# EAGLE board RobotRacers_RevQ (EAGLE 9.7.0), part 1 of 3
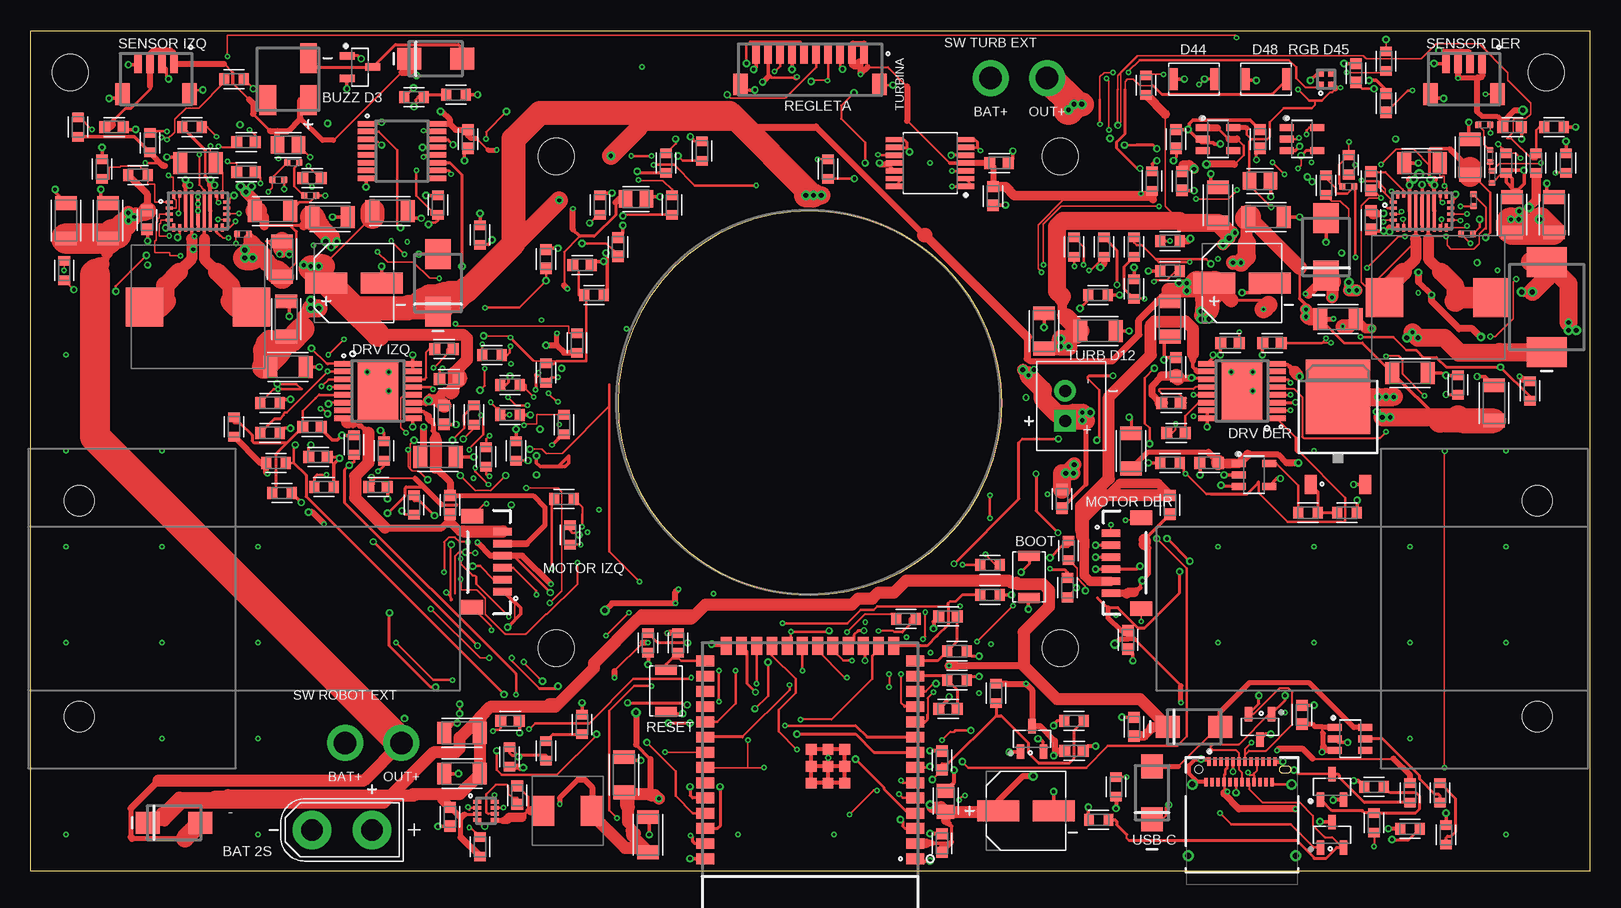
[diagram p14: board, top side]
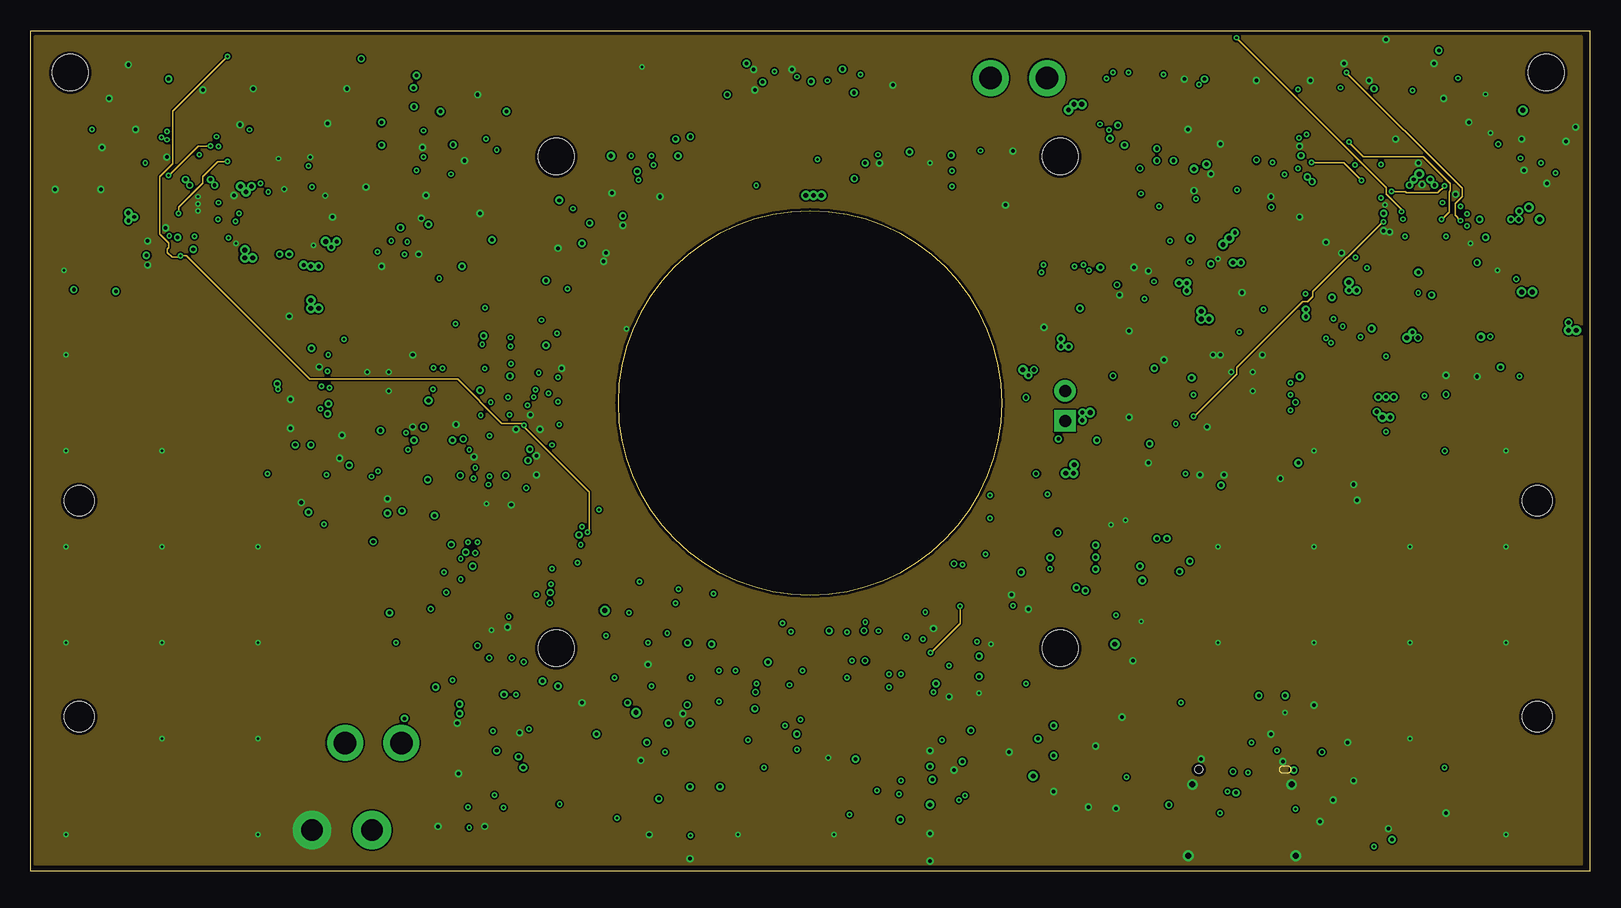
[diagram p15: board, inner layer Route2]
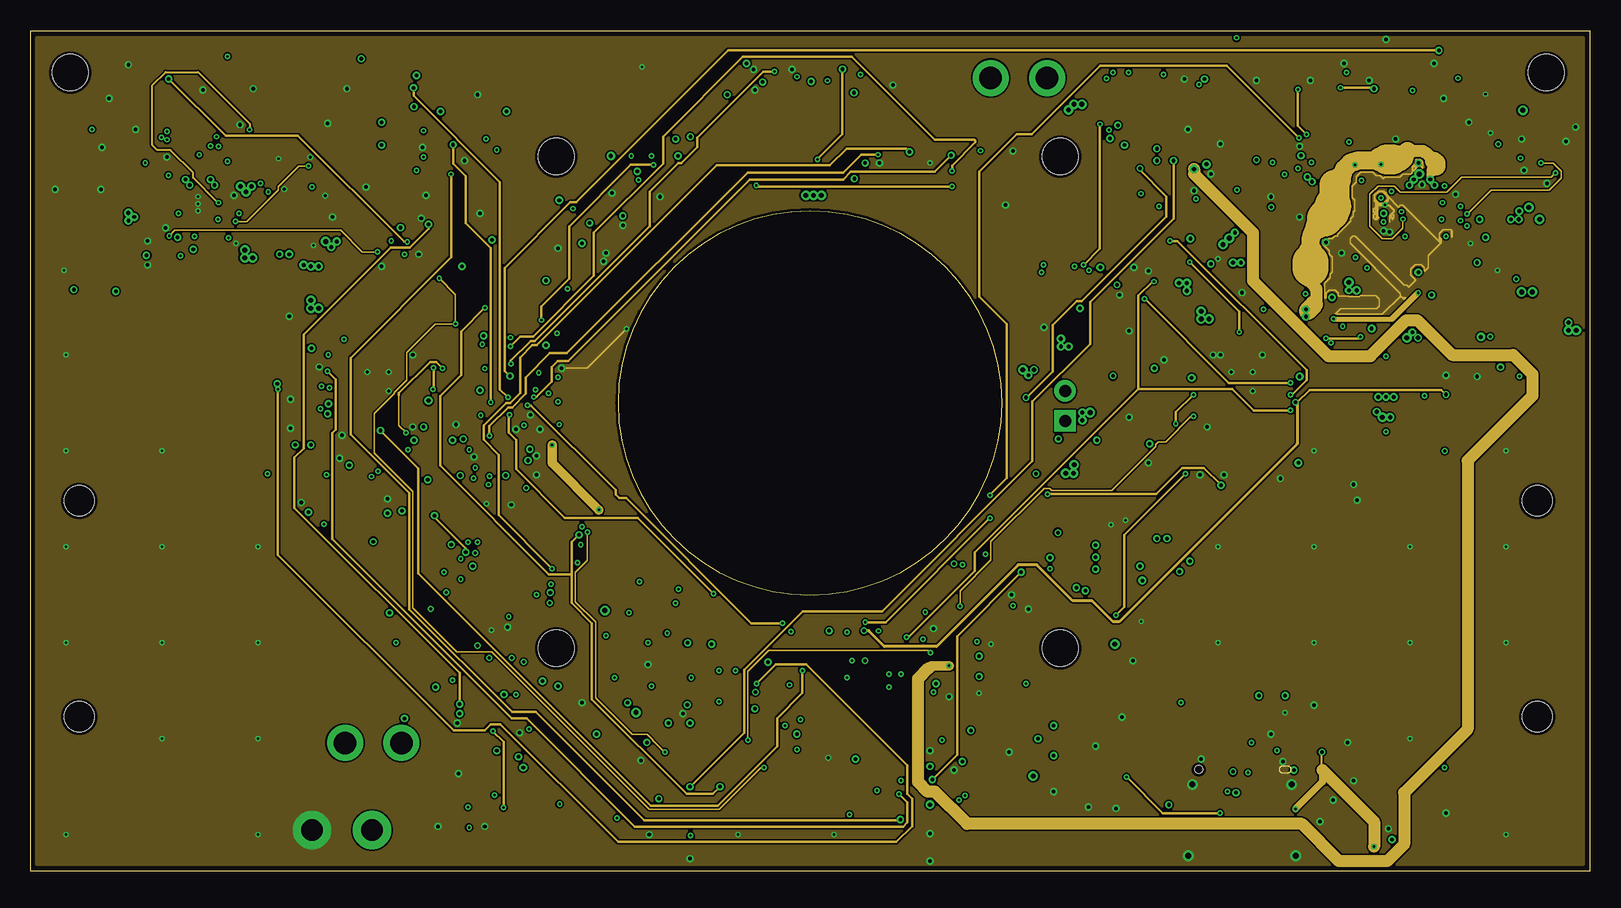
[diagram p16: board, inner layer Route15]
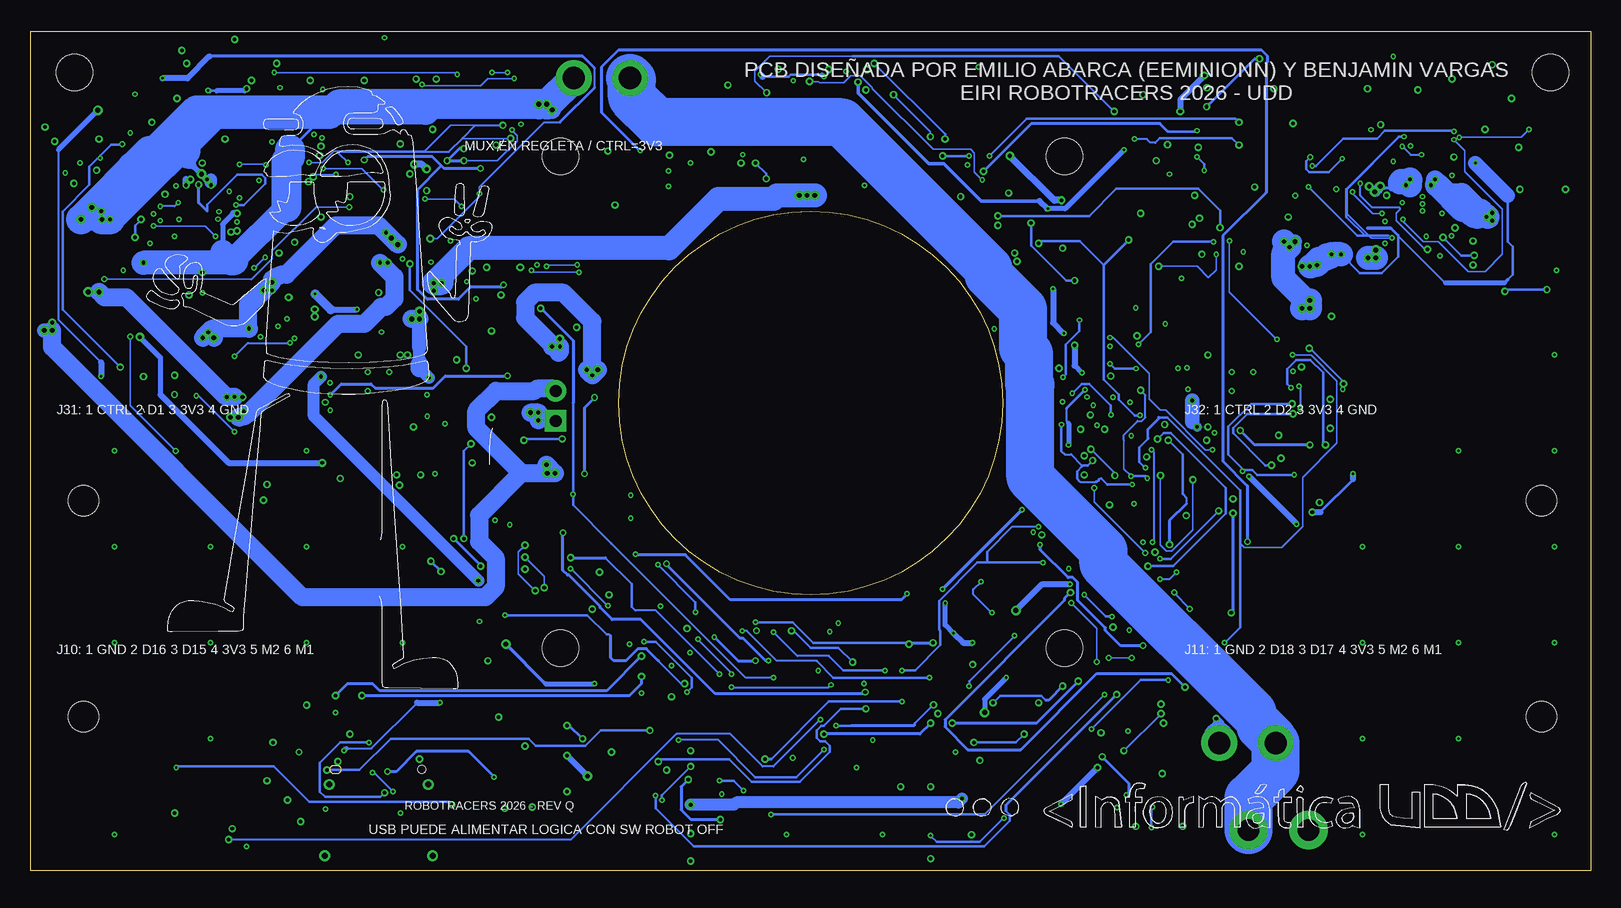
[diagram p17: board, bottom side, seen from below]

Size 130 x 70 mm. Coordinates in mm from the lower left corner, seen from the top.
Outline: 0,0 130,0 130,70 0,70 0,0
Outline: 81,39 arc180 49,39 arc180 81,39
Copper layers (1+2*15+16): Top 0.035mm / dielectric 0.2104mm / Route2 0.0152mm / dielectric 1.065mm / Route15 0.0152mm / dielectric 0.2104mm / Bottom 0.035mm
Design rules "RobotRacers Rev K - 4L L2-GND L3-signal-GND JLC04161H-7628": minimum track width 5mil, minimum drill 0.2mm, track to track 5mil, track to pad 5mil, pad to pad 0.16mm, via to via 0.16mm, smd to smd 0.16mm, copper to edge 0.25mm, drill to drill 6mil, minimum pad ring 0.2mm, minimum via ring 0.125mm, stop-mask expansion 0.05mm, vias tented up to drill 0.3mm, thermal gap 10mil
Net classes: 0 default: width 0.127 mm, drill 0.2 mm
Holes 3 mm at 43.85,18.55 43.85,59.55 85.85,18.55 85.85,59.55 3.35,66.55 126.35,66.55
Holes 2.5 mm at 4.1,12.85 4.1,30.85 125.6,12.85 125.6,30.85
tKeepout: area 41.4,16.1 to 46.4,21.1; area 41.4,57 to 46.4,62; area 83.3,16.1 to 88.3,21.1; area 83.3,57 to 88.3,62; area -0.1,8.6 to 17.2,15.1; area -0.1,15.1 to 35.9,28.7; area -0.1,28.7 to 17.2,35.1; area 112.5,8.6 to 129.8,15.1; area 93.8,15.1 to 129.8,28.7; area 112.5,28.7 to 129.8,35.1; area 0.8,64 to 5.8,69; area 123.8,64 to 128.8,69; area 46.9,21.1 to 82.8,57
bKeepout: area 41.4,16.1 to 46.4,21.1; area 41.4,57 to 46.4,62; area 83.3,16.1 to 88.3,21.1; area 83.3,57 to 88.3,62; area -0.1,8.6 to 17.2,15.1; area -0.1,15.1 to 35.9,28.7; area -0.1,28.7 to 17.2,35.1; area 112.5,8.6 to 129.8,15.1; area 93.8,15.1 to 129.8,28.7; area 112.5,28.7 to 129.8,35.1; area 0.8,64 to 5.8,69; area 123.8,64 to 128.8,69; area 46.9,21.1 to 82.8,57
tRestrict: area 48.9,23.1 to 80.8,55; area 1.1,9.9 to 7.1,15.9; area 1.1,27.9 to 7.1,33.8; area 122.6,9.9 to 128.6,15.9; area 122.6,27.9 to 128.6,33.8; area 41.4,16.1 to 46.4,21.1; area 41.4,57 to 46.4,62; area 83.3,16.1 to 88.3,21.1; area 83.3,57 to 88.3,62; area 0.8,64 to 5.8,69; area 123.8,64 to 128.8,69
vRestrict: area 48.9,23.1 to 80.8,55; area 1.1,9.9 to 7.1,15.9; area 1.1,27.9 to 7.1,33.8; area 122.6,9.9 to 128.6,15.9; area 122.6,27.9 to 128.6,33.8; area 41.4,16.1 to 46.4,21.1; area 41.4,57 to 46.4,62; area 83.3,16.1 to 88.3,21.1; area 83.3,57 to 88.3,62; area 0.8,64 to 5.8,69; area 123.8,64 to 128.8,69

## Footprints (pad centres in the part's own frame; a part is rotated, then mirrored left to right if it is on the bottom)
MLT5030 = smd 1.4 x 2.5: DUMMY -1.7,-1.75; N 1.7,1.75; P 1.7,-1.75
CAPC2012X110 = smd 1.165 x 1.465: 1 -0.875,0; 2 0.875,0
CAPC1608X85 = smd 0.921 x 0.97: 1 -0.775,0; 2 0.775,0
CAPC3216X135 = smd 1.165 x 1.815: 1 -1.475,0; 2 1.475,0
CAPC1005_0402 = smd 0.55 x 0.6: 1 -0.5,0; 2 0.5,0
CAPAE660X540N = smd 3.517 x 1.767: 1 -2.3,0; 2 2.3,0
SMC_DO214AB = smd 2.5 x 3.3: 1 -3.75,0; 2 3.75,0
SK6805_EC15 = smd 0.55 x 0.55: 1 -0.475,-0.475; 2 0.475,-0.475; 3 0.475,0.475; 4 -0.475,0.475
SS14 = smd 2 x 1.8: A 2.2,0; K -2.2,0
SMBJ6.5A = smd 2.5 x 2.1: A 2.4,0; K -2.4,0
12401832E402A = smd 0.3 x 0.7: A1 -2.75,5; A2 -2.25,5; A3 -1.75,5; A4 -1.25,5; A5 -0.75,5; A6 -0.25,5; A7 0.25,5; A8 0.75,5; A9 1.25,5; A10 1.75,5; A11 2.25,5; A12 2.75,5; B1 2.5,3.3; B2 2,3.3; B3 1.5,3.3; B4 1,3.3; B5 0.5,3.3; B6 0,3.3; B7 -0.5,3.3; B8 -1,3.3; B9 -1.5,3.3; B10 -2,3.3; B11 -2.5,3.3; B12 -3,3.3 | drill 0.5 slot 1.1 rotated 90: SH1 -4.13,3.09; SH2 4.13,3.09; SH3 4.49,-2.86; SH4 -4.49,-2.86 | hole 0.65: -3.6,4.34
JST-6-SMD-VERT-1.0MM = smd 0.6 x 1.55: 1 2.46,1.27; 2 1.46,1.27; 3 0.46,1.27; 4 -0.54,1.27; 5 -1.54,1.27; 6 -2.54,1.27 | smd 1.2 x 1.8: P$1 -3.84,-1.255; P$2 3.76,-1.255
JST_XH_B2B_VERTICAL = drill 1 pad 1.8 square: 1 -1.25,0 | drill 1 pad 1.8: 2 1.25,0
XT30UPB-M = drill 1.8 pad 3.2: + 2.5,0; - -2.5,0
JST_SH_10 = smd 0.6 x 1.55: 1 4.5,1.27; 2 3.5,1.27; 3 2.5,1.27; 4 1.5,1.27; 5 0.5,1.27; 6 -0.5,1.27; 7 -1.5,1.27; 8 -2.5,1.27; 9 -3.5,1.27; 10 -4.5,1.27 | smd 1.2 x 1.8: MP1 -5.8,-1.255; MP2 5.8,-1.255
JST_SH_4 = smd 0.6 x 1.55: 1 1.5,1.27; 2 0.5,1.27; 3 -0.5,1.27; 4 -1.5,1.27 | smd 1.2 x 1.8: MP1 -2.8,-1.255; MP2 2.8,-1.255
WIRE_SWITCH_2P = drill 1.85 pad 3: 2 0,0; 3 4.7,0
YSPI0530_REVN = smd 1.9 x 2.5: 1 -2.05,0; 2 2.05,0
IHLP4040DZ_01_4R7 = smd 3.124 x 3.251: 1 -4.471,0; 2 4.471,0
SOT95P237X112-3N = smd 1.224 x 0.625: 1 -1.064,0.95; 2 -1.064,-0.95; 3 1.064,0
TO252 = smd 1 x 1.6: 1 -2.28,-4.8; 2 2.28,-4.8 | smd 5.4 x 6.2: 3 0,2.5
RESC1608X60 = smd 0.799 x 0.974: 1 -0.815,0; 2 0.815,0
RESC3216X70 = smd 1.165 x 1.815: 1 -1.475,0; 2 1.475,0
RESC1005_0402 = smd 0.55 x 0.6: 1 -0.5,0; 2 0.5,0
B3U-1000P(M) = smd 0.8 x 1.8: 1 -1.75,0; 2 1.75,0
ESP32-S3-WROOM-1 = smd 1.5 x 0.9: 1 0.25,18.01; 2 0.25,16.74; 3 0.25,15.47; 4 0.25,14.2; 5 0.25,12.93; 6 0.25,11.66; 7 0.25,10.39; 8 0.25,9.12; 9 0.25,7.85; 10 0.25,6.58; 11 0.25,5.31; 12 0.25,4.04; 13 0.25,2.77; 14 0.25,1.5; 27 17.75,1.5; 28 17.75,2.77; 29 17.75,4.04; 30 17.75,5.31; 31 17.75,6.58; 32 17.75,7.85; 33 17.75,9.12; 34 17.75,10.39; 35 17.75,11.66; 36 17.75,12.93; 37 17.75,14.2; 38 17.75,15.47; 39 17.75,16.74; 40 17.75,18.01 | smd 0.9 x 1.5: 15 2.015,0.25; 16 3.285,0.25; 17 4.555,0.25; 18 5.825,0.25; 19 7.095,0.25; 20 8.365,0.25; 21 9.635,0.25; 22 10.905,0.25; 23 12.175,0.25; 24 13.445,0.25; 25 14.715,0.25; 26 15.985,0.25 | smd 0.9 x 0.9: 41_1 6.1,11.69; 41_2 6.1,10.29; 41_3 6.1,8.89; 41_4 7.5,11.69; 41_5 7.5,10.29; 41_6 7.5,8.89; 41_7 8.9,11.69; 41_8 8.9,10.29; 41_9 8.9,8.89
TI_DRL0008A = smd 0.67 x 0.3: 1 -0.74,0.75; 2 -0.74,0.25; 3 -0.74,-0.25; 4 -0.74,-0.75; 5 0.74,-0.75; 6 0.74,-0.25; 7 0.74,0.25; 8 0.74,0.75
TI_RYQ0021A = smd 0.6 x 0.25: 1 -2.4,0.75; 2 -2.4,0.25; 3 -2.4,-0.25; 4 -2.4,-0.75; 14 2.4,-0.75; 15 2.4,-0.25; 16 2.4,0.25; 17 2.4,0.75 | smd 0.25 x 0.65: 5 -2.04,-1.375; 13 2.04,-1.375; 18 2.04,1.375; 21 -2.04,1.375 | smd 0.25 x 0.6: 6 -1.54,-1.4; 12 1.54,-1.4; 19 1.54,1.4; 20 -1.54,1.4 | smd 0.25 x 3.4: 7 -1.04,0; 8 -0.54,0; 9A 0,0; 10 0.54,0; 11 1.04,0 | smd 0.33 x 2.35: 9 0,0
TI_PWP0016J = smd 1.5 x 0.45: 1 -2.9,2.275; 2 -2.9,1.625; 3 -2.9,0.975; 4 -2.9,0.325; 5 -2.9,-0.325; 6 -2.9,-0.975; 7 -2.9,-1.625; 8 -2.9,-2.275; 9 2.9,-2.275; 10 2.9,-1.625; 11 2.9,-0.975; 12 2.9,-0.325; 13 2.9,0.325; 14 2.9,0.975; 15 2.9,1.625; 16 2.9,2.275 | smd 3.4 x 5: 17 0,0
SOT95P280X145-5N = smd 1.186 x 0.597: 1 -1.264,0.95; 2 -1.264,0; 3 -1.264,-0.95; 4 1.264,-0.95; 5 1.264,0.95
TSSOP16_PW = smd 1.5 x 0.45: 1 -2.95,2.275; 2 -2.95,1.625; 3 -2.95,0.975; 4 -2.95,0.325; 5 -2.95,-0.325; 6 -2.95,-0.975; 7 -2.95,-1.625; 8 -2.95,-2.275; 9 2.95,-2.275; 10 2.95,-1.625; 11 2.95,-0.975; 12 2.95,-0.325; 13 2.95,0.325; 14 2.95,0.975; 15 2.95,1.625; 16 2.95,2.275
SOP65P640X120-14 = smd 1.45 x 0.45: 1 -2.95,1.95; 2 -2.95,1.3; 3 -2.95,0.65; 4 -2.95,0; 5 -2.95,-0.65; 6 -2.95,-1.3; 7 -2.95,-1.95; 8 2.95,-1.95; 9 2.95,-1.3; 10 2.95,-0.65; 11 2.95,0; 12 2.95,0.65; 13 2.95,1.3; 14 2.95,1.95
SOT95P280X145-6N = smd 1.165 x 0.597: 1 -1.275,0.95; 2 -1.275,0; 3 -1.275,-0.95; 4 1.275,-0.95; 5 1.275,0; 6 1.275,0.95

## Placement (x,y rotation side)
BZ1  MLT-5030  [MLT5030]  21.5,66 0 top
C1  10uF / 10V X7R  [CAPC2012X110]  76.3,5.8 270 top
C2  100nF / 16V X7R  [CAPC1608X85]  76,2.3 270 top
C3  1uF / 10V X7R  [CAPC1608X85]  76,9.2 270 top
C4  100nF / 16V X7R  [CAPC1608X85]  87,10 180 top
C5  DNP 10pF 50V C0G  [CAPC1608X85]  76.5,21.2 0 top
C6  DNP 10pF 50V C0G  [CAPC1608X85]  76.5,13.5 0 top
C100  100nF  [CAPC1608X85]  40,12.5 0 top
C101  22uF/25V  [CAPC3216X135]  36,8.1 180 top
C102  22uF/25V  [CAPC3216X135]  36,11.5 180 top
C103  100nF  [CAPC1608X85]  35,4.5 270 top
C104  100nF  [CAPC1608X85]  40.6,6.3 90 top
C105  22uF/25V  [CAPC3216X135]  51.5,3 90 top
C106  22uF/25V  [CAPC3216X135]  49.5,8 90 top
C110  22uF/25V  [CAPC3216X135]  6.5,54.2 90 top
C111  22uF/25V  [CAPC3216X135]  3,54.2 90 top
C112  100nF  [CAPC1608X85]  9.75,54.25 270 top
C113  22uF/25V  [CAPC3216X135]  14,59 180 top
C114  100nF  [CAPC1608X85]  18,58.25 0 top
C115  100nF  [CAPC1608X85]  18,60.75 180 top
C116  100nF  [CAPC1608X85]  23.5,57.75 0 top
C117  22uF/25V  [CAPC3216X135]  20.2,55 0 top
C118  22uF/25V  [CAPC3216X135]  21.35,46 90 top
C119  22uF/25V  [CAPC3216X135]  21.5,42 0 top
C120  22uF/25V  [CAPC3216X135]  25,54.5 0 top
C121  22uF/25V  [CAPC3216X135]  30,55 0 top
C122  100nF  [CAPC1005_0402]  23.35,56.3 0 top
C123  100pF  [CAPC1005_0402]  20.7,57.6 0 top
C124  100nF  [CAPC1005_0402]  17.75,53.1 180 top
C130  100nF  [CAPC1608X85]  23.5,37 0 top
C131  10nF  [CAPC1608X85]  24,34.5 0 top
C132  22uF/25V  [CAPC3216X135]  34,34.5 0 top
C133  100nF  [CAPC1608X85]  34.5,38 270 top
C134  100nF  [CAPC1608X85]  34.9,41 0 top
C135  22nF  [CAPC1608X85]  34.5,43.5 180 top
C136  100nF  [CAPC1608X85]  29,32 0 top
C150  100nF  [CAPC1608X85]  103.5,44 180 top
C151  10nF  [CAPC1608X85]  100,44 180 top
C152  22uF/25V  [CAPC3216X135]  95,46 270 top
C153  100nF  [CAPC1608X85]  95.5,42 90 top
C154  100nF  [CAPC1608X85]  95.1,39 180 top
C155  22nF  [CAPC1608X85]  95.5,36.5 0 top
C156  100nF  [CAPC1608X85]  91.5,19.25 270 top
C170  100nF  [CAPC1608X85]  98.25,34 180 top
C171  22uF/25V  [CAPC3216X135]  91.75,35 90 top
C172  22uF/25V  [CAPC3216X135]  89,45 0 top
C173  22uF/25V  [CAPC3216X135]  84.5,45 90 top
C174  100nF  [CAPC1608X85]  86,31 90 top
C210  22uF/25V  [CAPC3216X135]  123.5,54.7 90 top
C211  22uF/25V  [CAPC3216X135]  127,54.7 90 top
C212  100nF  [CAPC1608X85]  111.75,54.25 270 top
C213  22uF/25V  [CAPC3216X135]  116,59 180 top
C214  100nF  [CAPC1608X85]  111.75,57.5 270 top
C215  100nF  [CAPC1005_0402]  120.3,55.9 90 top
C216  100nF  [CAPC1005_0402]  109.85,57.05 0 top
C217  22uF/25V  [CAPC3216X135]  120,59.5 90 top
C218  22uF/25V  [CAPC3216X135]  122,39 90 top
C219  22uF/25V  [CAPC3216X135]  103,54.5 0 top
C220  22uF/25V  [CAPC3216X135]  115,41.5 0 top
C221  22uF/25V  [CAPC3216X135]  99,55.5 90 top
C222  22nF  [CAPC1005_0402]  121.2,62.2 0 top
C223  100pF  [CAPC1005_0402]  121.85,57.85 270 top
C224  100nF  [CAPC1005_0402]  119.75,53.1 180 top
C310  100nF  [CAPC1608X85]  36.5,61 270 top
C311  10uF  [CAPC2012X110]  50.5,56 0 top
C312  100nF  [CAPC1608X85]  7,62 0 top
C313  100nF  [CAPC1608X85]  123.5,62 0 top
C320  100pF  [CAPC1608X85]  46,50.5 0 top
C321  100pF  [CAPC1608X85]  43,51 90 top
C322  100pF  [CAPC1608X85]  49,52 90 top
C323  100nF  [CAPC1608X85]  80.75,59 0 top
C324  1uF  [CAPC1608X85]  80.25,56.25 270 top
C330  100nF  [CAPC1608X85]  95.5,61 90 top
C331  100nF  [CAPC1608X85]  102.5,61 90 top
C332  1uF  [CAPC1608X85]  96,57.5 270 top
C333  10uF  [CAPC2012X110]  102.5,57.5 0 top
C334  100nF  [CAPC1608X85]  113,64 90 top
C335  100nF  [CAPC1608X85]  110.5,66.5 90 top
C336  10uF  [CAPC2012X110]  21.5,60.5 0 top
C340  1uF  [CAPC1608X85]  106,13 90 top
C341  100nF  [CAPC1608X85]  92,12 90 top
C350  100uF/16V  [CAPAE660X540N]  83,5 0 top
C351  100uF/16V  [CAPAE660X540N]  27,49 0 top
C352  100uF/16V  [CAPAE660X540N]  101,49 0 top
C353  22nF/50V  [CAPC1608X85]  35,30.5 90 top
C354  22nF/50V  [CAPC1608X85]  95,30.5 90 top
D10  SS1045  [SMC_DO214AB]  126.4,47 90 top
D30  SK6805-EC15  [SK6805_EC15]  108,66 0 top
D31  SS14  [SS14]  97,12 0 top
D32  SS14  [SS14]  12,4 0 top
D33  SS14  [SS14]  33.8,67.7 0 top
D34  SMBJ6.5A  [SMBJ6.5A]  34,49 90 top
D35  SMBJ6.5A  [SMBJ6.5A]  108,52 90 top
D36  SS14  [SS14]  93.5,6.5 90 top
J1  12401832E402A  [12401832E402A]  101,4.1 0 top
J10  BM06B-SRSS-TB(LF)(SN)  [JST-6-SMD-VERT-1.0MM]  38.11,25.72 270 top
J11  BM06B-SRSS-TB(LF)(SN)  [JST-6-SMD-VERT-1.0MM]  91.35,25.68 90 top
J12  B2B-XH-A(LF)(SN)  [JST_XH_B2B_VERTICAL]  86.25,38.75 90 top
J20  XT30UPB-M  [XT30UPB-M]  26,3.4 0 top
J30  BM10B-SRSS-TB(LF)(SN)  [JST_SH_10]  65,66.8 0 top
J31  BM04B-SRSS-TB(LF)(SN)  [JST_SH_4]  10.5,66 0 top
J32  BM04B-SRSS-TB(LF)(SN)  [JST_SH_4]  119.5,66 0 top
J40  SW_EXTERNO_CABLES  [WIRE_SWITCH_2P]  26.25,10.65 0 top
J41  SW_EXTERNO_CABLES  [WIRE_SWITCH_2P]  80.05,66.1 0 top
L10  4.7uH/5030  [YSPI0530_REVN]  44.8,5 0 top
L11  4.7uH/9.5A  [IHLP4040DZ_01_4R7]  14,47 0 top
L20  4.7uH/9.5A  [IHLP4040DZ_01_4R7]  117.35,47.8 0 top
Q1  MMBT3904LT1G  [SOT95P237X112-3N]  108.5,7 90 top
Q10  AOD4184A  [TO252]  109,37 0 top
Q30  AO3400A  [SOT95P237X112-3N]  27.5,67 0 top
R1  10k  [RESC1608X60]  80.5,14.8 90 top
R2  10k  [RESC1608X60]  54,19 90 top
R3  10k  [RESC1608X60]  51.5,19 90 top
R4  10k  [RESC1608X60]  115,3.5 0 top
R5  1k  [RESC1608X60]  87,12.5 0 top
R6  5.1k 1%  [RESC1608X60]  90.5,7 90 top
R7  5.1k 1%  [RESC1608X60]  89.05,4.25 0 top
R8  22R  [RESC1608X60]  77.25,15.9 180 top
R9  22R  [RESC1608X60]  77.25,18.3 180 top
R10  10k  [RESC1608X60]  112,4 90 top
R11  100k  [RESC1608X60]  112,7 0 top
R12  10k  [RESC1608X60]  115,6.5 90 top
R100  100k  [RESC1608X60]  37.5,2 90 top
R101  100k  [RESC1608X60]  39.95,9.5 90 top
R102  22k  [RESC1608X60]  43,10 90 top
R103  10k  [RESC1608X60]  46,12.2 90 top
R110  100k  [RESC1608X60]  9,58 0 top
R111  23.2k  [RESC1608X60]  6,58.5 90 top
R112  49.9k  [RESC1608X60]  2.85,50.05 90 top
R113  12mR/1W  [RESC3216X70]  21,51 90 top
R114  100R  [RESC1608X60]  13.5,62 0 top
R115  100R  [RESC1608X60]  10,60.7 90 top
R116  100k  [RESC1608X60]  4,62 90 top
R117  24.9k  [RESC1608X60]  17,66 0 top
R118  3.3k  [RESC1005_0402]  21.95,59.05 0 top
R120  100k  [RESC1608X60]  20,39 0 top
R121  100k  [RESC1608X60]  20,36.5 0 top
R122  100k  [RESC1608X60]  27,35.5 90 top
R123  10k  [RESC1608X60]  20.5,34 0 top
R124  10k  [RESC1608X60]  17,37 90 top
R125  10k  [RESC1608X60]  21,31.5 0 top
R126  2.4k  [RESC1608X60]  24.5,32 0 top
R127  1k  [RESC1608X60]  29.5,35 90 top
R128  1k  [RESC1608X60]  32,30.5 90 top
R129  1k  [RESC1608X60]  37,38 90 top
R140  100k  [RESC1608X60]  95,34 180 top
R141  100k  [RESC1608X60]  95,50 180 top
R142  100k  [RESC1608X60]  119,40.5 90 top
R143  10k  [RESC1608X60]  95,52.5 180 top
R144  10k  [RESC1608X60]  125,40 270 top
R145  10k  [RESC1608X60]  123,59 270 top
R146  2.4k  [RESC1608X60]  92,48.5 90 top
R147  1k  [RESC1608X60]  92,52 90 top
R148  1k  [RESC1608X60]  86.45,23.6 90 top
R149  1k  [RESC1608X60]  86.55,26.7 90 top
R160  100k  [RESC1608X60]  89,48 0 top
R161  22R  [RESC1608X60]  106.5,29.85 0 top
R162  100k  [RESC1608X60]  109.75,29.85 0 top
R210  100k  [RESC1608X60]  125.5,59 90 top
R211  23.2k  [RESC1608X60]  127,62 0 top
R212  49.9k  [RESC1608X60]  128,59 90 top
R213  18mR/1W  [RESC3216X70]  109,46 0 top
R214  100R  [RESC1608X60]  109.9,58.85 90 top
R215  100R  [RESC1608X60]  108,57.15 90 top
R216  100k  [RESC1608X60]  93,65.5 90 top
R217  24.9k  [RESC1608X60]  113,67.5 90 top
R218  3.3k  [RESC1005_0402]  121.65,59.6 90 top
R300  4.7k  [RESC1608X60]  45.59,44 90 top
R301  22R  [RESC1608X60]  73,21 0 top
R302  22R  [RESC1608X60]  80,25.5 0 top
R303  100k  [RESC1608X60]  40.5,35 90 top
R304  100k  [RESC1608X60]  40,38 0 top
R310  100k  [RESC1608X60]  34,55.5 90 top
R311  100R  [RESC1608X60]  53,59 90 top
R312  100R  [RESC1608X60]  56,60 90 top
R313  100R  [RESC1608X60]  53.5,55.5 90 top
R314  100R  [RESC1608X60]  66.5,58.5 90 top
R320  1k  [RESC1608X60]  38.5,43 0 top
R321  1k  [RESC1608X60]  40,40.5 0 top
R322  1k  [RESC1608X60]  38,34.5 90 top
R323  1k  [RESC1608X60]  43,41.5 90 top
R324  1k  [RESC1608X60]  45,28 90 top
R325  1k  [RESC1608X60]  44.5,31 0 top
R326  10k  [RESC1608X60]  47,48 0 top
R327  10k  [RESC1608X60]  47.5,55.5 90 top
R328  10k  [RESC1608X60]  37.5,53 90 top
R330  10k  [RESC1608X60]  93.5,57.5 90 top
R331  10k  [RESC1608X60]  89.5,52 90 top
R332  100R  [RESC1608X60]  87,52 90 top
R333  100R  [RESC1608X60]  32,64.5 0 top
R334  10k  [RESC1608X60]  80,23 0 top
R335  100k  [RESC1608X60]  35.5,64.7 0 top
R340  49.9k  [RESC1608X60]  117.5,6.5 90 top
R341  10k  [RESC1608X60]  118,3 90 top
R360  4.7k  [RESC1608X60]  44.5,37.2 90 top
S1  RESET  [B3U-1000P(M)]  83.25,24.5 90 top
S2  BOOT  [B3U-1000P(M)]  53,15 90 top
S3  ACCION_1  [B3U-1000P(M)]  97,66 0 top
S4  ACCION_2  [B3U-1000P(M)]  103,66 0 top
U1  ESP32-S3-WROOM-1-N16R8  [ESP32-S3-WROOM-1]  74,19 180 top
U2  TLV803EA30DBZR  [SOT95P237X112-3N]  83.5,11 90 top
U3  TPD2E2U06QDBZRQ1  [SOT95P237X112-3N]  102.5,12 270 top
U4  TPD2E2U06QDBZRQ1  [SOT95P237X112-3N]  108.5,3 90 top
U10  TPS62933DRLR  [TI_DRL0008A]  38,5 0 top
U11  TPS55289RYQR  [TI_RYQ0021A]  14,55 0 top
U12  DRV8874PWPR  [TI_PWP0016J]  29,40 0 top
U13  DRV8874PWPR  [TI_PWP0016J]  101,40 180 top
U14  UCC27517DBVR  [SOT95P280X145-5N]  102,33 0 top
U20  TPS55289RYQR  [TI_RYQ0021A]  116,55 0 top
U31  SN74HC595PWR  [TSSOP16_PW]  31,60 0 top
U32  TLV9064IPWR  [SOP65P640X120-14]  75,59 180 top
U33  TPS70950DBVR  [SOT95P280X145-5N]  99,61 0 top
U34  SN74LV1T34DBVR  [SOT95P280X145-5N]  106,61 0 top
U35  TPS2553DBVR  [SOT95P280X145-6N]  110,11 0 top

## Tracks (layer width: path | path; a pad name or v marks a point on that pad's centre or on a via)
3V3_MAIN  (via drill 0.2 pad 0.45, 0.3 pad 0.6, 0.3 pad 0.65, 0.35 pad 0.7, 0.4 pad 0.8)
  Top 0.127: R143.1 96.02,52.7 v96.7,52.7 | v92.6,56.45 93.13,55.92 | 93.13,55.92 93.68,55.92 | R331.1 88.36,50.05 v88.25,50.05 | v84.3,49.9 84,50.2 84,53.85 86.07,55.92 93.13,55.92 | R360.1 44.5,36.17 44.1,36.17 44,36.09
  Top 0.16: 28.5,32.73 32.07,32.73 | 37.2,61.07 38.18,60.1 | 42.13,40.13 v42.13,40.11 | v43.9,44.8 | 44.5,48.8 44.5,51.6 45.8,52.9 | 51.05,19 48.7,16.65 | 53.27,19.82 53.26,19.8 | 69.8,67 71.49,67 73.1,65.39 | 73.1,62.53 76.63,59 | 89.44,50.54 89.48,50.54 89.5,50.56 | 106.88,9.34 113.62,9.34 | 119,66.1 v119,66.08
  Top 0.2: 16.18,67.27 16.9,66.55 | 16.9,65.65 18.25,64.3 | 25.3,60.89 30.95,66.54 | 28.5,32.84 v28.47,32.87 | v43.5,35.5 | 61.83,66.13 63.83,66.13 | 91.49,19.3 91.5,19.31 91.5,19.32
  Top 0.25: 18.6,63.09 20.01,61.67 | 34.3,30.5 35.6,30.5 34.15,30.5 32.65,32 31.35,32 31.25,31.9 31.25,31.25 v29.8,29.8 | 42.2,40.2 42.2,41.31 | 45.8,52.9 47.02,52.9 48.8,54.68 48.8,55.72 | 61.5,66.45 61.6,66.35 | 61.55,66.25 61.55,66.3 61.6,66.35 | 61.6,66.35 61.83,66.13 | 76.8,2.4 76.8,3.7 | 95.9,15.45 92.03,19.32 | 89.85,21.95 89.75,21.95 | 89.75,21.95 88.95,22.75 89.75,21.95 | v37.3,27.4 38.45,26.25 40.3,26.25 v43.35,23.2 | v33.8,15.3 33.4,15.3 29.95,18.75 v29.95,21.5 | 10,65.42 10,65.15 8.4,63.55 7.95,63.55 6.95,62.54 | J11.4 v88.8,25.14 92.24,25.14 v92.5,25.4 | 89.75,21.95 90.65,21.95 90.65,21.9 92.3,20.25 92.9,20.25 95.8,23.15 v95.8,24.95 | v96.65,25.8 v94.75,27.7
  Top 0.3: 16.9,66.55 16.9,65.65 | 42.2,40.2 42.13,40.13 | v43.5,35.5 44,36 44,36.09 | 45.8,52.9 45.23,53.47 | 50.5,10.5 51.7,9.3 | J30.9 61.5,66.45 | 76.7,2.3 75.25,2.3 | 76.63,59 U32.4 | 76.63,3.87 76.8,3.7 | 124.27,41.07 124.27,40.9 124.36,40.81 R144.1
  Top 0.4: 6.77,62 6.95,62.18 6.95,62.54 | 11.7,68.41 10.3,68.41 | 32.07,32.73 34.3,30.5 | 36.5,61.31 36.73,61.07 37.2,61.07 | 37.3,27.32 v37.3,27.4 | 38.18,60.1 v38.9,60.1 | 42.2,41.31 v42.39,41.5 | 43.9,43.8 v43.9,44.8 | v44.14,5.56 44.14,6.07 45.69,7.61 | 61.55,66.25 v61.05,65.75 | 75.25,2.3 74.96,2.3 | 76,2.03 76.43,2.03 76.7,2.3 76.8,2.4 | 76.47,4.03 76.63,3.87 | 81.35,15.62 81.36,15.6 | v90.4,18.9 90.8,19.3 91.49,19.3 | 92.03,19.32 91.5,19.32 C156.1 90.88,20.03 89.85,21.05 89.85,21.95 | v95.9,14 95.9,15.45 | 119,66.1 120.6,66.1 120.63,66.13 | 120.6,63.3 121,62.9 122.25,62.9 122.72,62.42 | 122.72,62.42 | 25.3,60.89 24.36,60.89 22.54,62.71
  Top 0.5: C312.1 6.77,62 | 10,65.42 J31.3 10,68.11 10.3,68.41 | 11.7,68.41 12,68.11 J31.1 16.18,67.27 | R124.1 19.19,34 R123.1 19.69,33.21 v19.8,33.1 | 18.25,64.3 18.6,63.95 18.6,63.09 | 20.01,61.67 20.62,61.67 | C336.1 20.62,61.67 | 20.62,61.67 21.5,61.67 22.54,62.71 22.54,64.25 BZ1.P | v23.2,29.9 23.5,29.9 v24.5,28.9 | C136.1 28.5,32.27 28.5,32.73 28.5,32.84 | 30.95,66.54 31.6,66.54 | D33.K 31.6,66.54 | 31.6,66.54 31.96,66.54 v32.2,66.3 | U31.16 34.96,62.27 | v34.2,63.3 34.33,63.3 34.96,62.67 34.96,62.27 | 34.96,62.27 35.46,61.77 C310.1 36.5,61.31 | 37.3,27.32 38.36,26.26 J10.4 41.04,26.26 v43.4,23.9 | R101.1 40.7,8.69 40.78,8.6 v41.1,8.6 | v43,43.8 43.9,43.8 44.52,43.18 R300.1 | 44.5,48.8 v44.8,48.5 | 45.23,53.47 | 45.23,53.47 v45.23,55.2 | 45.69,7.61 46.2,7.61 46.85,6.96 L10.2 | v47.9,21.7 48.5,22.3 v53.79,22.3 53.79,23.24 v54.03,23.47 | 48.7,16.65 v48.7,16.1 | 48.8,55.72 49.08,56 C311.1 | 50.05,3.85 50.2,3.7 50.2,3.5 | v50.5,13.2 50.5,10.5 | v51.5,19 51.05,19 | 51.7,9.3 51.7,6.3 | 53.26,19.8 v53.1,19.8 | R2.2 53.27,19.82 | 63.83,66.13 v63.9,66.2 | 68.57,68.97 68.5,68.91 J30.2 68.5,67.2 68.61,67.09 69.06,67.09 69.06,67.43 69.1,67.47 69.2,67.37 | 68.57,68.97 | 68.57,68.97 69.5,68.97 J30.1 | 69.2,67.37 | 69.8,67 v69.2,66.4 69.2,67.37 | 73.1,65.39 73.1,62.53 | C2.2 76,2.03 | U32.4 C323.1 80.25,58.72 C324.1 | R1.2 81.35,15.62 | C350.1 80.7,5.84 82.75,7.9 v83.6,7.9 | 81.36,15.6 v83,15.6 83,15.52 83.08,15.52 83.5,15.1 U2.3 84.17,12.06 85.4,10.84 85.4,10 85.5,10 | v85.3,9.6 85.5,9.8 85.5,10 | C4.2 85.5,10 | v89.2,50.3 89.44,50.54 | R331.1 89.5,50.56 | 93.68,55.92 93.5,55.92 93.5,56.3 R330.1 | R143.1 96.58,52.5 96.58,52.58 v96.7,52.7 | v103.9,10 104.1,10.2 106.02,10.2 106.88,9.34
  Top 0.5: 113.62,9.34 115,7.96 R12.2 | 119,66.1 J32.3 | 120.6,63.3 120.6,66.1 | 120.63,66.13 120.88,66.13 121,66.26 J32.1 | C313.1 122.72,62.42 123.7,63.4 v124.4,63.4 | 124.27,41.07 v124.12,41.22
  Top 0.6: 50.05,3.85 49.85,4.05 | 50.14,3.36 50.14,3.44 50.2,3.5 | 74.96,2.3 74.67,2.3 | v75,5.5 75.2,5.3 | 76.3,4.2 76.47,4.03
  Top 0.8: 50.2,3.17 50.2,3.3 | U1.2 73.8,2.3 74.67,2.3 | 76.3,4.9 76.3,4.2 | C324.1 81.3,57.02 82.02,56.3 93.5,56.3
  Top 1: L10.2 46.5,5 49.6,1.9 51.1,1.9 51.2,1.8 | 49.7,6.3 49.5,6.5 | 49.5,6.5 50.1,6.5 50.2,6.4 51.6,6.4 51.7,6.3 52.1,6.3 v52.4,6 | 49.5,6.5 C106.1 | 49.7,6.3 49.7,5.4 49.85,5.25 | 49.7,6.3 49.9,6.1 49.9,5.3 49.85,5.25 | 49.85,4.05 49.85,5.25 | 50.14,3.36 50.2,3.3 50.4,3.1 50.4,2.7 | 50.2,3.17 50.2,2.9 50.4,2.7 | 50.4,2.7 51.2,1.9 51.2,1.8 | 51.2,1.8 51.5,1.5 C105.1 | 75.2,5.3 75.9,5.3 76.3,4.9 | 76.3,4.9 80.6,4.9 C350.1 | 76.3,4.9 C1.2
  Route15 0.8: v43.5,35.5 43.5,34 v47.4,30.1
  Bottom 0.127: v96.7,52.7 96.1,52.7 92.6,56.2 v92.6,56.45 92.6,57 87.2,62.4 | v88.25,50.05 88.1,49.9 v84.3,49.9
  Bottom 0.16: 43.5,37.3 43.7,37.5 43.7,38.53 | 83,65.3 83,66.9 | 87.2,62.4 85.9,62.4 | 97.8,14 101.6,10.2 103.7,10.2 | 124.12,42.38 127.69,45.94 127.69,60.11
  Bottom 0.2: v43.5,35.5 | 64.06,66.36 66.66,66.36 66.82,66.2 69,66.2
  Bottom 0.25: 22.53,29.9 19.8,32.63 | v42.13,40.11 43.7,38.53 | 85.9,62.4 83,65.3 | 83,66.9 84,67.9 115.1,67.9 | v43.35,23.2 43.85,22.7 43.85,22.55 53.8,12.6 53.8,12 51.9,10.1 47.5,10.1 41.15,16.45 34.95,16.45 v33.8,15.3 | v29.95,21.5 29.8,21.65 v29.8,29.8 | v95.8,24.95 v96.65,25.8 | v94.75,27.7 92.5,25.45 v92.5,25.4
  Bottom 0.3: 45.95,55.85 50.8,55.85 53.9,58.95 55.15,58.95 61.05,64.85 v61.05,65.75 | v47.4,30.1 v54.03,23.47 | v90.4,18.9 87.1,15.6
  Bottom 0.4: v38.9,60.1 43.8,55.2 v45.23,55.2 | 43,42.11 v42.39,41.5 | 43.5,37.3 v43.5,35.5 | v48.7,16.1 50.5,14.3 v50.5,13.2 | v53.1,19.8 53.79,20.49 v53.79,22.3 | 64.06,66.36 v63.9,66.2 | 87.1,15.6 v83,15.6 | v103.9,10 103.7,10.2 | v124.4,63.4 127.69,60.11
  Bottom 0.5: 19.8,32.63 v19.8,33.1 | v23.2,29.9 22.53,29.9 | v28.47,32.87 v24.5,28.9 | v32.2,66.3 34.2,64.3 v34.2,63.3 | v41.1,8.6 v44.14,5.56 | v43,43.8 43,42.11 | v43.4,23.9 45.7,23.9 v47.9,21.7 | v43.9,44.8 44.8,45.7 v44.8,48.5 | v45.23,55.2 45.3,55.2 45.95,55.85 | v51.5,19 52.3,19 v53.1,19.8 | v69.2,66.4 69,66.2 | v85.3,9.6 v83.6,7.9 | 97.8,14 v95.9,14 | 115.1,67.9 116.92,66.08 v119,66.08 | 124.12,42.38 v124.12,41.22
  Bottom 1: v52.4,6 52.7,5.7 71.2,5.7 71.4,5.5 v75,5.5
BAR_ANALOG  (via drill 0.2 pad 0.45, 0.3 pad 0.6)
  Top 0.16: v37.5,40.05 37.9,40.45 v37.9,41.87
  Top 0.2: R322.1 38,33.02 38.16,33.02 v38.29,32.89 | v62.06,66.64 62.5,67.08 J30.8
  Route15 0.2: v40.07,42.27 40.07,42.54 41.71,44.18 42.08,44.18 51.66,53.77 51.66,56.64 54.01,58.99 54.28,58.99 55.59,60.31 55.59,61.11 61.12,66.64 v62.06,66.64
  Bottom 0.127: 37.4,37.5 37.1,37.8 | v38.29,32.89 38.9,33.5 38.9,35.9
  Bottom 0.16: 38.9,35.9 38.9,36.35 37.75,37.5 37.4,37.5 | 37.1,37.8 37.1,39.65 v37.5,40.05
  Bottom 0.2: v36.95,32.73 37.12,32.89 v38.29,32.89 | v37.9,41.87 39.67,41.87 v40.07,42.27
BAR_IN  (via drill 0.2 pad 0.45)
  Top 0.2: v38.29,36.26 38,35.98 R322.2 | v70.66,59.7 70.71,59.65 U32.10
  Route15 0.2: v38.29,36.26 38.29,37.07 39.85,38.64 40.17,38.64 41.31,39.78 41.31,41.13 43.33,43.15 44.74,43.15 59.8,58.21 67.76,58.21 69.25,59.7 v70.66,59.7
BAT_RAW
  Bottom 2.5: 27.5,12 28.2,12.7 28.2,13.2
  Bottom 4: J20.+ 28.5,6.1 26.25,8.35 J40.2 26.5,10.9 26.5,11 27.5,12 | 28.2,13.2 40.6,25.6 40.6,26.7 46.7,32.8 46.7,40.5 46.8,40.6 46.8,43.1 47.3,43.6 47.3,46.8 50.2,49.7 50.2,50.2 62.4,62.4 77.8,62.4 79.9,64.5 79.9,65.95 J41.2
BOOT1_6V  (via drill 0.2)
  Top 0.127: v12.38,54.8 12.45,54.8 U11.20 | v16.45,59.12 16.45,59 17.2,59 17.23,58.97 C114.1 | C114.1
  Route2 0.127: v12.38,54.8 12.38,55.32 14.4,57.35 14.4,57.88 15.65,59.12 v16.45,59.12
BOOT2_6V  (via drill 0.2 pad 0.45)
  Top 0.16: 15.6,55.8 v15.7,55.7
  Top 0.2: U11.19 15.6,56.34 15.6,55.8 | v18.3,61.79 18.78,61.31 C115.1
  Route15 0.16: v18.3,61.79 18.3,62.3 14,66.6 11.3,66.6 10.2,65.5 10.2,60.5 10.6,60.1 11.7,60.1 13.6,58.2 13.6,57.78 15.58,55.8 15.6,55.8 v15.7,55.7
BST_3V3
  Top 0.16: 38.02,4.86 38.04,4.84 38.08,4.84 | 38.02,6.08 38.02,6 | U10.6 38.17,4.75 | 38.83,7.18 39.72,7.18 39.8,7.1 | 39.86,6.93 39.8,6.98
  Top 0.2: 38.02,6 38.02,4.86 | 38.02,6.08 38.02,6.36 38.83,7.18 | 38.08,4.84 38.17,4.75 | 39.8,6.98 39.8,7.1 | 39.86,6.93 39.86,6.43 40.22,6.06 40.6,6.06 C104.1
BUF_BAR  (via drill 0.2 pad 0.45, 0.3 pad 0.6)
  Top 0.2: v43.5,25.2 43.5,30.81 R325.1
  Top 0.25: U32.9 73.06,60.3 | U32.8 72.84,60.95 73.06,60.73 73.06,60.3 | 73.06,60.3 73.3,60.06 v73.3,59.94
  Route15 0.2: v43.5,25.2 39.04,29.65 39.04,34.68 37.79,35.93 37.79,37.1 39.69,39 40.02,39 40.84,39.83 40.84,42.8 41.86,43.82 42.23,43.82 57.24,58.83 66.66,58.83 68.05,60.22 73.02,60.22 v73.3,59.94
BUF_L  (via drill 0.2 pad 0.45)
  Top 0.2: R323.1 43.45,41.14 v43.99,41.14 | v51.95,58.86 53.68,58.86 55.41,57.13 v60.52,57.13 | U32.1 v76.84,57.05
  Top 0.25: U32.1 78.6,57.05 U32.2
  Route15 0.2: v42.61,45.91 42.61,47.05 44.92,49.36 44.92,53.72 50.08,58.88 51.93,58.88 v51.95,58.86 | v60.52,57.13 60.6,57.05 v76.84,57.05
  Bottom 0.2: v42.61,45.91 42.61,44.99 43.74,43.86 43.74,41.38 v43.99,41.14
BUF_R  (via drill 0.2 pad 0.45, 0.3 pad 0.55)
  Top 0.2: 78.96,60.3 79.2,60.06 v79.2,60.04 | R324.1 v45.9,27.19 | U32.6 78.94,60.3
  Top 0.25: 78.94,60.3 78.96,60.3 78.96,60.73 78.74,60.95 U32.7 | v28.6,27.45 v37.3,18.75
  Bottom 0.25: v37.3,18.75 39.15,18.75 40.45,20.05 40.45,20.25 42.75,22.55 42.75,24.05 43.15,24.45 43.55,24.45 45.85,26.75 45.85,27.15 45.88,27.19 v45.9,27.19 | v28.6,27.45 28.6,32.1 30.65,34.15 30.65,52.95 27.05,56.55 27.05,67.35 26.95,67.45 26.95,67.95 27.45,68.45 81,68.45 82.4,67.05 82.4,63.2 79.24,60.04 v79.2,60.04
BUF_UNUSED
  Top 0.25: U32.14 72.7,57.7 U32.13
BUZZ_GATE  (via drill 0.3 pad 0.6)
  Top 0.25: Q30.1 27.35,67.95 v27.6,67.7 | v32,63.7 32.13,63.83 32.13,64.28 32.35,64.5 R333.2 33.02,64.7 R335.1
  Bottom 0.25: v27.6,67.7 28,67.7 v32,63.7
BUZZ_MINUS
  Top 0.25: BZ1.N 23.95,67 Q30.3 30.45,68.89 35.7,68.89 36,68.59 D33.A
COMP_6V  (via drill 0.2 pad 0.45)
  Top 0.127: R118.1 20.2,57.8 C123.1 20.2,56.95 v19.85,56.6 | U11.15 16.45,54.8 v17.4,54.8
  Bottom 0.127: v17.4,54.8 18.15,54.8 19.85,56.5 v19.85,56.6
COMP_RC
  Top 0.2: R118.2 22,58.6 22,57.1 22.8,56.3 C122.1
EN_3V3  (via drill 0.2 pad 0.45)
  Top 0.2: v36.5,5.3 36.6,5.2 36.6,5.1 36.75,5.25 U10.2 | v36.6,3.6 36.6,3.71 R100.2
  Bottom 0.2: v36.5,5.3 36.6,5.2 v36.6,3.6
EN_6V
  Top 0.127: U11.1 10.4,55.75 10.38,55.77 10.38,57.25 9.85,57.25 9.82,57.27 R110.2 9.82,58.05 9.82,58.55 9.22,58.55 9.22,58.72 9.2,58.75 7.52,58.75 7.52,58.7 7.5,58.67 6.6,58.67 6.6,57.7 6.57,57.67 R111.1
ESP_BOOT
  Top 0.2: 54,17.75 54.25,17.5 U1.27
  Top 0.25: S2.2 53,17.21 53.54,17.75 54,17.75 R2.1
ESP_EN  (via drill 0.2 pad 0.45, 0.3 pad 0.6)
  Top 0.2: U31.10 34.91,58.38 34.96,58.32 34.96,58.21 v35.1,58.08 | v75.2,7.6 76,8.4
  Top 0.25: v72.53,4.27 72.71,4.09 72.71,3.72 72.9,3.53 U1.3 | 76,8.4 C3.2 76,8.92 76.5,8.92 80.5,12.93 | 80.5,12.93 80.93,12.93 83.2,10.66 83.2,9.84 84.04,9 86.62,9 87,9.38 87,11.69 R5.2 | R1.1 80.5,12.93 | v82.6,24.9 82.6,24.91 83.25,25.56 S1.2
  Route15 0.2: v35.1,58.08 35.1,51.14 26.71,42.76 26.71,36.38 31.6,31.49 31.6,21.8 40.17,13.23 42.17,13.23 51.2,4.19 72.44,4.19 v72.53,4.27 | v75.2,7.6 77.26,9.66 77.26,19.56 v82.6,24.9
  Bottom 0.25: v72.53,4.27 74.97,4.27 75.8,5.1 75.8,7 v75.2,7.6
FAN_BAT  (via drill 0.3 pad 0.6, 0.3 pad 0.65, 0.35 pad 0.65, 0.35 pad 0.7, 0.4 pad 0.8)
  Top 0.32: U20.7 v114.96,57.16
  Top 0.4: C171.1 93.12,34.9 98.2,34.9
  Top 0.5: 101.49,34.7 104,34.7 104.7,34 | v114.96,57.16 114.96,57.63 | 115.7,49.1 v116.8,48
  Top 0.6: 98.2,34.9 99.02,34.07 | v105.7,34 104.7,34 | 111.97,54.8 v112.8,54.8 | 114.96,57.63 v115.31,57.63 v115.77,58.09 | v115.7,49.9 115.7,49.1 | v120.9,44.5 120.2,45.2 119.1,45.2 116.8,47.5 v116.8,48 | v124.9,55.3 123.5,53.9
  Top 0.8: 99.07,33.95 U14.1 101.49,34.7 | v123.4,54.3 v124.11,55.01 | v124.9,55.3 125.5,55.9 R210.1
  Top 1: C170.1 99.07,33.95 | C212.1 111.97,54.8
  Top 1.2: 99.02,34.07 C170.1
  Top 2: v87,63.9 v87.65,63.9 | 123.5,53.2 123.4,53.3 123.4,53.55 | 123.4,54.05 v123.4,54.3 v124.05,54.3 | 123.5,53.2 C210.1 123.5,53.9 | 123.5,53.2 126.97,53.2 C211.1 125.92,54.3 v125.8,54.3
  Top 2.5: J41.3 84.8,66.1 v87,63.9 v86.54,63.44 | 123.4,54.05 123.4,53.55
  Bottom 0.2: 86.95,63.9 v87,63.9
  Bottom 0.25: 104.6,63.9 108.4,60.1
  Bottom 0.4: 113.1,54.8 114,53.9 114,51.6 | 115.87,58.17 116.43,58.73 | 119.2,39.7 119.2,42.8 v120.9,44.5
  Bottom 0.5: v105.7,34 113.5,34 119.2,39.7
  Bottom 0.6: v112.8,54.8 113.1,54.8 | 114,51.6 v115.7,49.9 | v114.96,57.16 114.96,57.4 | 114.96,57.63 v115.31,57.63 v115.77,58.09 | 115.2,57.6 115.3,57.6 115.87,58.17 | 116.43,58.73 116.62,58.92
  Bottom 0.8: 115,57.4 115.2,57.6 | 116.62,58.92 116.81,59.11
  Bottom 1: 114.96,57.63 114.96,57.4 115,57.4
  Bottom 1.2: 116.81,59.11 117,59.3
  Bottom 1.5: v87,63.9 v86.54,63.44 | 117,59.3 117,59.7
  Bottom 2: 104.3,63.9 104.6,63.9 | 113.1,50.9 108.7,55.3 | 113.2,50.9 113.4,50.7 v120.6,50.7 | 114,51.6 113.3,50.9 | 117,59.7 117,59.9 117.1,60 | 121.5,58.7 v124.9,55.3
  Bottom 2.4: 96.6,63.9 97.1,63.4 116.2,63.4
  Bottom 2.5: J41.3 86.95,63.9 | v87,63.9 v87.65,63.9 96.6,63.9 104.3,63.9 105.1,63.1 114.7,63.1 123.4,54.4 v123.4,54.3 | 116.2,63.4 119.6,60 | 119.6,60 119.9,60 | 108.4,60.1 108.4,59.5 108.7,59.2 108.7,55.3 | 113.3,50.9 113.2,50.9 113.1,50.9 | 117.1,60 119.6,60 | 119.9,60 121.2,58.7 121.5,58.7 | 119.9,60 120.1,60 v125.8,54.3 | v123.4,54.3 v124.05,54.3 | v123.4,54.3 v124.11,55.01
FAN_BOOT1_6V
  Top 0.16: U20.20 114.46,56.66 114.44,56.66 114.4,56.7 114.4,56.8 112.95,58.25 111.75,58.25 C214.1
FAN_BOOT2_6V  (via drill 0.2 pad 0.45)
  Top 0.16: U20.19 117.54,55.86 v117.7,55.7 | v119.2,55.4 C215.1
  Bottom 0.16: v117.7,55.7 118,55.4 v119.2,55.4
FAN_COMP_6V  (via drill 0.2 pad 0.45)
  Top 0.127: R218.1 121.65,58.55 C223.1 122.45,58.95 125.85,58.95 v125.9,59 | U20.15 v119.75,54.75
  Route15 0.127: 127.6,58.35 126.95,59 | 126.95,59 v125.9,59 126.95,59 | v119.75,54.75 121.75,56.75 126.6,56.75 127.6,57.75 127.6,58.35 | 127.6,58.35 126.95,59
FAN_COMP_RC
  Top 0.127: C222.1 120.7,62.15 121.15,61.7 121.15,60.6 R218.2
FAN_EN_6V  (via drill 0.2 pad 0.45, 0.3 pad 0.6)
  Top 0.127: v106.45,57.85 106.9,57.4 v106.85,57.45 | 111.1,67.95 92.3,67.95 90.65,66.3 90.65,65.15 | v104.55,58.05 v103.55,59.05 | 110.97,57.45 110.97,57.52 v110.97,57.55 112.25,57.55 112.95,56.85 112.95,56.44 113.6,55.79 | 123.45,61.05 123.05,61.05 123.6,61.6 123.6,62.6 123.7,62.7 124.65,62.7 125.05,63.1 125.05,64 123.15,65.9 123.15,66.55 120.75,68.95 117.2,68.95 115.95,67.7 111.35,67.7 111.1,67.95 | 111.1,67.95 92.25,67.95 90.9,66.6 90.9,62.4 v90.65,62.15
  Top 0.16: 113.6,55.79 112.45,56.94 112.45,57.45 110.97,57.45 | v90.65,62.15 90.65,65.15 | 123.45,61.05 125.19,59.31 125.5,59.31
  Top 0.2: U20.1 113.6,55.79 | 125.5,59.31 R210.2 125.5,61.73 125.77,62
  Top 0.25: 125.77,62 R211.1
  Route2 0.127: v110.97,57.55 109.47,59.05 v106.8,59.05
  Bottom 0.127: v90,61.05 93.95,61.05 94,61.1 | v106.45,57.85 106.25,58.05 v104.55,58.05 | v103.55,59.05 104.35,59.85 104.35,59.95 | v90.65,62.15 95,62.15 97.15,60 104.75,60 105.7,59.05 v106.8,59.05
  Bottom 0.16: 104.35,59.95 95.15,59.95 94,61.1 92.95,62.15 v90.65,62.15
FAN_FB_6V  (via drill 0.2 pad 0.45)
  Top 0.127: R216.2 93.08,66.4 v94.45,66.4 | v109.7,66.55 112.86,66.55 R217.1 | U20.14 119.15,54.25 v119.2,54.2
  Route2 0.127: v119.2,54.2 118.75,54.65 118.75,55.65 118.8,55.65 119.35,56.2 119.35,56.9 v109.7,66.55
  Bottom 0.127: v94.45,66.4 94.6,66.55 v109.7,66.55
FAN_FSW_6V  (via drill 0.2 pad 0.45)
  Top 0.127: U20.6 114.46,54.27 | 114.46,54.27 v114.4,54.33 114.46,54.27
  Top 0.2: R212.1 v127.12,58.18
  Route15 0.127: v127.12,58.18 126.78,57.85 119.3,57.85 118.05,56.6 114.2,56.6 113.7,57.1 112.35,57.1 111.65,56.4 111.65,53.75 112.7,52.7 113.5,52.7 114.4,53.6 v114.4,54.33
FAN_GATE
  Top 0.25: Q10.1 107.31,31.61 R161.2 R162.1
FAN_GATE_DRV
  Top 0.2: R161.1 105.68,32.11 103.85,33.95 U14.5
FAN_ISN_6V  (via drill 0.2 pad 0.45)
  Top 0.127: U20.13 119.72,53.62 119.75,53.65 v119.75,53.75
  Top 0.2: R215.2 108,57.7 108.8,56.9 108.8,56.6 108.95,56.45 109.75,56.45 C216.2 110.45,56.95 v110.45,51.15 | v111.4,50.25 114.05,52.9 v114.6,52.9
  Bottom 0.127: v119.75,53.75 115.45,53.75 v114.6,52.9
  Bottom 0.2: v110.45,51.15 111.35,50.25 v111.4,50.25
FAN_ISP_6V  (via drill 0.2 pad 0.45)
  Top 0.127: U20.12 117.64,53.7 v117.64,54.3 | R214.2 v109.9,60.77
  Top 0.2: R214.2 109.1,58.86 109.1,57.3 C216.1
  Route2 0.127: v109.9,60.77 111.11,59.55 116.1,59.55 118.35,57.3 118.35,56.7 118.25,56.6 118.25,54.91 v117.64,54.3
FAN_MINUS  (via drill 0.3 pad 0.65, 0.35 pad 0.65, 0.4 pad 0.8)
  Top 0.8: v124.3,48.25 v125.2,48.25
  Top 1.2: v86.96,33.15 v86.31,33.15 v87.01,33.85
  Top 1.5: C174.2 86,33.15 v86.31,33.15 | Q10.3 v112.35,39.5 v113,39.5 v113.65,39.5 | 125,50.8 125,50.75 | v128.21,45.71 128.21,48.94 D10.2 126.4,49.45 v125.2,48.25
  Bottom 0.6: v113,39.5 v112.35,39.5 | v128.21,45.06 v128.21,45.71
  Bottom 0.8: v124.3,48.25 v125.2,48.25
  Bottom 1.2: v128.21,45.06 v128.86,45.06
  Bottom 1.5: J12.2 86.45,40.2 87.8,40.2 88,40 91.22,40 92.86,38.36 92.86,36.9 89.1,33.15 | v87.01,33.85 v86.31,33.15 v86.96,33.15 89.1,33.15 | 89.1,33.15 92.62,29.62 92.62,27.45 91.26,26.09 91.26,23.64 92.12,22.79 107.35,22.79 128.21,43.64 v128.21,45.06 | v113,39.5 v113.65,39.5 113.7,39.5 122,47.8 122.65,47.8 123.85,47.8 v124.3,48.25
FAN_SW1_6V  (via drill 0.2 pad 0.45)
  Top 0.127: 115.4,54.94 115.4,52.4 111.73,48.74 111.27,48.74 110.94,49.07 110.94,55.47 111.56,56.1 v112.6,56.1
  Top 0.16: C214.2 111.97,56.72 v112.6,56.1 | U20.8 115.4,54.94
  Top 0.3: U20.8 115.46,52.7
  Top 0.9: 114.4,49.94 115.46,51 115.46,52.7
  Top 1.5: 113.25,47.5 113.25,48.79 114.4,49.94
  Top 1.8: 113.25,47.5 112.95,47.8 L20.1
FAN_SW2_6V  (via drill 0.2 pad 0.45)
  Top 0.127: v118,52.9 118.1,52.9 118.1,52.15 118.4,51.85 120.3,51.85 120.75,52.3 120.75,53.1 121.25,53.6 121.35,53.5
  Top 0.16: U20.10 116.54,53.16 116.8,52.9 v118,52.9 | 121.35,53.5 121.35,55.3 120.3,56.35 C215.2
  Top 0.3: U20.10 116.54,52.7
  Top 0.9: 117.6,49.94 116.54,51 116.54,52.7
  Top 1.5: 118.75,47.5 118.75,48.79 117.6,49.94
  Top 1.8: 118.75,47.5 119.05,47.8 L20.2
FAN_V_EXT  (via drill 0.2 pad 0.45, 0.3 pad 0.65, 0.35 pad 0.65, 0.35 pad 0.7, 0.4 pad 0.8)
  Top 0.127: 94.6,63.08 94.6,55.4 95.8,54.2 | R215.1 108.48,55.85 109.2,55.85 109.9,55.15 v109.9,49.05
  Top 0.3: C174.1 88,32.22
  Top 0.4: 88,32.22 88,37.5
  Top 0.6: v83.2,41.3 v83.66,41.76 | v99.94,52.74 v100.4,53.2 100.1,53.2
  Top 0.8: 86,47.62 86,46.5 86.19,46.31 | v87.7,38.2 v88.35,38.2 | v109.9,48.4 v109.9,49.05 | v115.2,44.9 v114.74,44.44 | R216.1 94.6,63.08 | 109.85,45.38 R213.2 111.27,45.2 v111.8,45.2
  Top 1: v83.2,41.3 v82.74,41.76 | C173.1 84.5,43.5 85.2,43.5 | 85.3,43.6 85.2,43.5 | 85.2,43.5 85.7,43.5 v85.9,43.7 | v99.94,52.74 v99.41,52.21 | v109.9,48.4 v110.55,48.4
  Top 1.2: 85.3,43.6 85.6,43.6 86.2,44.2 | 86,47.9 86,47.62 | 86.19,46.31 86.38,46.12 | 100.1,53.2 99.8,53.2 | 109.85,45.38 v109.39,45.38
  Top 1.5: v83.2,41.3 84.4,40.1 84.4,39.29 85.59,38.1 87.6,38.1 v87.7,38.2 | v86.55,43.7 v85.9,43.7 v85.9,44.35 | 86,47.9 85.6,48.3 85.6,53.7 86.1,54.2 95.8,54.2 96,54 99,54 | 86.2,44.2 86.4,44.2 86.9,44.7 87.2,44.7 87.5,45 | 88,37.5 J12.1 86.94,38.19 87,38.19 87.01,38.2 v87.7,38.2 | 86.38,46.12 87.5,45 | 87.5,45 C172.1 | v87.7,38.2 v87.7,37.55 | 99,54 C221.1 | 99.8,53.2 99,54 | v115.2,44.9 115.3,44.8 v115.66,44.44 117.86,44.44 119.1,43.2 122.4,43.2 122.45,43.25 D10.1
  Bottom 0.6: v85.9,43.7 v85.9,44.35 | 109.9,48.7 v109.9,48.4 v110.55,48.4
  Bottom 1: 109.9,48.7 v109.9,49.05
  Bottom 1.5: v83.2,41.3 v82.74,41.76 | v83.2,41.3 83.2,45.8 85.6,48.2 88,48.2 88.8,47.4 88.8,46.1 86,43.3 86,43.2 85.9,43.3 v85.9,43.7 v86.55,43.7 | v83.2,41.3 v83.66,41.76 | v87.7,37.55 v87.7,38.2 v88.35,38.2 | v99.41,52.21 v99.94,52.74 v100.4,53.2 101,53.8 104.6,53.8 108.7,49.7 109.2,49.7 109.3,49.6 109.4,49.6 109.5,49.5 109.6,49.5 109.8,49.3 109.9,49.3 v109.9,49.05 | v115.2,44.9 v114.74,44.44 | v115.2,44.9 114.9,45.2 v111.8,45.2 111.86,45.26 111.86,47.38 111.57,47.38 v110.55,48.4 | v115.2,44.9 v115.66,44.44
FAN_VCC_6V  (via drill 0.2)
  Top 0.127: v113.45,56.62 113.95,56.62 U20.21 | U20.18 118.05,57.07 118.02,57.1 v117.88,57.1 117.85,57.15 117.85,57.88 117.82,57.9 117.47,57.9 C213.1 | C213.1
  Route2 0.127: v113.45,56.62 114.6,56.62 114.7,56.52 117.3,56.52 v117.88,57.1
FAN_VM_RAW  (via drill 0.2 pad 0.45, 0.3 pad 0.6, 0.3 pad 0.65, 0.35 pad 0.65, 0.35 pad 0.7, 0.4 pad 0.8)
  Top 0.127: 110.4,58.53 R214.1 110.4,58.53 | 110.4,58.53 v110.4,58.83 110.4,58.53 | v112.6,58.9 113.85,60.15 115.3,60.15 116.69,58.76 v116.69,57.63
  Top 0.2: 105.8,50.3 105.8,47.72 | 107.52,45.97 R213.1 | 111.02,44 109.5,44 | 116.6,58 117,57.6 117.03,57.63 | C224.1 120.8,53.65 v120.8,54.3 | v121.3,52.8 121.7,53.2 121.7,56.55 118.3,59.95 118.3,60.05 118.2,60.15 116.75,60.15 116.65,60.05 116.65,57.15 117.04,56.76 U20.11
  Top 0.25: 109.5,44 107.52,45.97 | C220.1 111.02,44 | 117.04,56.86 116.6,57.3 116.6,58 116.6,60.1 | 118.3,60.2 116.7,60.2
  Top 0.3: 105.8,47.72 R213.1 | 117.5,37.52 C220.1 | 116.7,60.2 116.6,60.1 | 117.04,56.86 U20.11
  Top 0.32: U20.11 v117.04,57.16
  Top 0.4: R213.1 v108.62,46 | 120,58.5 118.3,60.2
  Top 0.5: v117.04,57.16 117.04,57.63
  Top 0.6: v112.7,37.8 v112.24,38.26 | 117.04,57.63 117.03,57.63 v116.69,57.63
  Top 1: 101.4,52.36 101.4,54.11 | v106.32,46.2 106.52,46 107.12,46 | v106.32,46.8 107.12,46 | 107.12,46 R213.1
  Top 1.2: v100.9,50.7 v100.25,50.7 | 101.6,54.5 105.8,50.3
  Top 1.5: v100.9,50.7 101.4,51.2 101.4,52.36 | 101.4,54.11 101.4,54.4 | 101.5,54.5 C219.1 | 119,37.8 v113.35,37.8 v112.7,37.8 | C218.1 122,37.5
  Top 2: 101.4,54.4 101.5,54.5 | C219.1 101.6,54.5 | C218.1 117.5,37.52 | 119,37.8 119.3,37.5 122,37.5 | C217.1 120,58.5
  Route15 0.4: v108.62,46 113.49,46 | v117.04,57.16 116.69,57.51 v116.69,57.63
  Route15 0.5: 113.49,46 v115.69,48.2
  Route15 0.6: v116.69,57.63 116.69,58.2 116.89,58.4
  Route15 0.65: v106.32,46.8 106.32,46.5 v106.32,46.2
  Route15 1: 117.02,59.18 116.3,59.9 116.2,59.9 116.1,60 114.8,60 | 106.7,49.38 106.7,49.1 107.1,48.7 107.1,48.6 107.2,48.5 107.2,47.4 107.02,47.22 | 106.48,46.68 106.3,46.5 106.32,46.5 | 116.89,58.4 117.2,58.71
  Route15 1.5: 117.02,59.18 117.2,59 117.2,58.71 | 114.8,60 114.27,59.47 | 112.5,59.3 112.4,59.2 110.5,59.2 110.4,59.1 110.2,59.1 110.1,59 110,59 109.5,58.5 109.5,58.4 109.4,58.3 109.4,58.1 109.3,58 109.3,57.8 109.1,57.6 | 107.3,53.7 106.9,53.3 106.9,53.1 106.8,53 106.8,52.8 106.7,52.7 106.7,51.59 | 106.7,49.65 106.7,49.38 | 107.02,47.22 106.48,46.68
  Route15 2: 114.27,59.47 114.1,59.3 113.57,59.3 | 113.03,59.3 112.5,59.3 | 109.1,57.6 108.7,57.2 | 107.7,54.1 107.3,53.7 | 106.7,51.59 106.7,51.04 | 106.7,49.93 106.7,49.65
  Route15 2.5: 113.57,59.3 113.03,59.3 | 108.7,57.2 108.7,55.6 108.6,55.5 | 107.9,54.4 107.9,54.3 107.7,54.1 | 106.7,51.04 106.7,50.76 | 106.7,50.21 106.7,49.93
  Route15 3: 108.6,55.5 108.6,55.3 108.4,55.1 108.4,54.9 107.9,54.4 | 106.7,50.76 106.7,50.21
  Bottom 0.127: v110.4,58.83 110.46,58.9 v112.6,58.9
  Bottom 0.2: v120.8,54.3 121.3,53.8 v121.3,52.8
  Bottom 0.6: v100.9,50.7 v100.25,50.7 | v112.7,37.8 v113.35,37.8 | v116.69,57.63 117.04,57.63 v117.04,57.16
  Bottom 1: v112.7,37.8 v112.24,38.26
  Bottom 1.5: v100.9,50.7 99.7,49.5 99.7,47.7 100.4,47 100.8,47 102.2,45.6 104.4,45.6 112,38 112.1,38 112.2,37.9 112.4,37.9 112.5,37.8 v112.7,37.8
FB3_LOW
  Top 0.25: R102.2 43.57,11.39 R103.1
FB_3V3  (via drill 0.2 pad 0.45, 0.3 pad 0.6)
  Top 0.2: v38.7,6.3 38.74,6.26 U10.8
  Top 0.25: v40.7,9.5 40.57,9.63 40.16,9.63 39.95,9.84 R101.2 40.62,9.64 43,9.64 R102.1
  Bottom 0.2: 38.5,6.4 38.6,6.3 v38.7,6.3
  Bottom 0.25: 38.5,6.4 38.5,7.3 v40.7,9.5
FB_6V  (via drill 0.2 pad 0.45)
  Top 0.127: U11.14 16.35,54.3 v15.65,54.3 | R117.1 16.19,65.73 14.05,63.6 13,63.6 12.05,62.65 12.05,61.6 v11.4,60.95 11.2,61.15 v10.95,61.15 | v5.15,61.8 4.13,62.81 R116.2
  Bottom 0.127: v15.65,54.3 15.65,54.15 13.95,52.45 12.7,52.45 10.2,49.95 8.8,49.95 7.35,51.4 7.35,55.15 10.5,58.3 10.5,60.05 v11.4,60.95 | v10.95,61.15 5.8,61.15 v5.15,61.8
FSW_6V  (via drill 0.3 pad 0.6)
  Top 0.2: U11.6 12.46,52.96 v12.3,52.8 | v9.7,51.3 7.15,48.75 v7.15,48.3 | v3.65,48.45 2.87,49.23 R112.1
  Bottom 0.2: v12.3,52.8 10.8,51.3 v9.7,51.3 | v7.15,48.3 7,48.45 v3.65,48.45
GND  (via drill 0.2, 0.2 pad 0.45, 0.25 pad 0.5, 0.3 pad 0.6)
  Top 0.127: R117.2 18.5,65.33 v18.6,65.2 | v113,69.3 R217.2 | v29.9,40 U12.17 | v101.9,40 U13.17 | U20.2 113.1,55.25 112.9,55.45 v112.9,55.5 | C124.2 17.15,53 v17.15,52.3 | C224.2 v120.05,52.3 | C222.2 v121.7,61.5 | J10.1 40.4,22.24 40.4,20.9 v39.8,20.3 | J10.P$1 37.91,30.61 v38.05,30.61 | J11.P$1 v92.6,20.79 | R112.2 v2.85,50.06 | J11.1 v90.08,28.84 | J11.P$2 92.41,29.24 v91.3,29.24 | J32.MP2 v121.3,64.74 | C223.2 122.68,58.18 R145.2 | J10.P$2 38.45,20.36 v38.45,20.06
  Top 0.16: 14,55.41 U11.9A | v17,56.3 16.95,56.3 U11.17
  Top 0.2: J1.SH2 103.71,7.19 J1.B1 | v26,36.3 25.9,36.2 | v118,41.3 117.8,41.5 117.6,41.5 | v70.8,59 70.8,58.8 | v24.6,56.3 C122.2 23.3,55.75 22.43,55.75 22.3,55.62 | C123.2 v21.2,56.85 | U20.2 113.15,55.25 v112.9,55.5 | v23.35,59.5 22.38,60.47 C336.2 | 7.05,64.4 7.4,64.74 J31.MP1 | J32.MP1 117.04,64.4 117.34,64.4 | J30.MP1 59.65,65.1 59.95,65.1 | J30.MP2 70.84,65.5 v71.9,65.5 | J31.MP2 13.65,65.1 v14.4,65.1
  Top 0.25: v14,55.6 14,55.41 | v91.6,37.8 91.75,37.65 C171.2 | C131.2 25.52,34.5 25.62,34.4 v25.8,34.4
  Top 0.3: 94.5,42.8 v94.5,42.6 | D35.A v108,52.4 | v101,48.2 102.5,48.2 C352.2 | D34.A v32.4,51.4 | C351.2 v29.3,50.4 | C350.2 v85.3,6.6 | v91,12.8 91.97,12.8 C341.2 | R341.2 v118,4.8 | v107,13.8 106.02,13.8 C340.2 | v109.8,10.7 109.02,10.7 U35.2 | R335.2 v37.3,64.7 | R334.2 v81.8,23 | v26.4,65.2 26.4,66.01 Q30.2 | v109.5,67.3 110.47,67.3 C335.2 | v106.7,65.9 107.27,66.47 D30.4 | v111.6,65.9 112.2,65.9 113,65.1 C334.2 | v105.8,60.4 105.45,60.05 U34.3 | v103.4,56.2 103.4,57.47 C333.2 | v97,56.7 96.02,56.7 C332.2 | v99.2,60.6 98.7,60.6 98.6,60.7 97.6,60.7 97.3,61 | 96.6,61.7 97.3,61 | 96.6,61.7 96.6,62.3 96.9,62.6 101.67,62.6 C331.2 | v102.2,65.9 101.35,65.9 S4.1 | C330.2 95.52,61.8 v96.5,61.8 96.6,61.7 | S3.1 v96.2,66 | v81.3,55.5 80.27,55.5 C324.2 | v81.9,60 81.9,59.38 C323.2 | v49.4,53.8 49.4,53.17 C322.2 | R328.2 v37.5,54.8 | v44,51.9 43.12,51.9 C321.2 | v48.5,56.5 47.69,56.5 R327.2 | v47.8,50.8 47.08,50.8 C320.2 | v48,51.5 48.1,51.4 48.1,48.28 R326.2 | 70.8,58.8 71.6,58.8 U32.12 | U32.11 v70.8,59 | v124.3,61 124.3,61.97 C313.2 | v8.8,61.8 7.97,61.8 C312.2 | 117.34,64.4 v117.8,64.4 | v117,67.3 117.97,67.3 J32.4 | 7.05,64.4 v6.6,64.4 | v8.2,67.2 8.93,67.2 J31.4 | v33,56.3 33.98,56.3 R310.2 | v52.5,56.2 51.58,56.2 C311.2 | v36.2,59.2 36.2,59.92 C310.2 | 59.95,65.1 v60.4,65.1 | J30.7 v63.5,66.8 | v60.3,66.8 60.5,67 J30.10 | v28,57 28,57.67 U31.8 | v32.7,60.3 33.93,60.3 U31.13 | R303.2 v40.5,36.8 | 44,33.7 44.6,33.7 44.9,34 44.9,34.6 44,33.7 | 44,33.7 42.5,33.7 42.2,34 v42.2,34.6 | v120.6,41.2 121.27,41.2 C218.2 | v119.9,62.4 119.9,61.07 C217.2 | C220.2 117.6,41.5 | v98.4,58.1 98.4,57.57 C221.2 | C213.2 v115.7,59 | v126.4,57.3 126.4,56.77 C211.2 | C219.2 v105.8,54.5
  Top 0.3: v112.8,53.35 111.88,53.35 C212.2 | 113.3,53.6 113.93,53.6 U20.5 | v118.8,56.4 118.8,56.15 U20.17 | R211.2 v128.8,62 | R212.2 v128,60.8 | C173.2 v84.5,45.3 | C172.2 v91.6,45 | v97.5,33 97.5,33.97 C170.2 | v110.6,30.9 110.6,29.89 R162.2 | R160.2 v90.8,48 | Q10.2 v110.3,32.2 | v104.2,32.7 103.91,32.7 U14.4 | U14.2 v99.5,33 | v91.9,17.5 91.9,18.07 C156.2 | 94.5,42.8 95.47,42.8 C153.2 | 94.5,42.8 94.5,44.02 C152.2 | v99.2,43 99.2,43.97 C151.2 | R146.2 v92,50.3 | v102.7,43 102.7,43.97 C150.2 | R145.2 123,57.4 123.6,56.8 124,56.8 124.5,57.3 v124.5,58.4 123.21,58.4 R145.2 | v118,41.3 118.98,41.3 R142.2 | R141.2 v93.2,50 | R140.2 v93.2,34 | v98.6,43 98.6,42.77 U13.9 | U13.15 U13.16 v98.1,37 | v29.8,31 29.8,31.98 C136.2 | v35.5,37.2 34.52,37.2 C133.2 | C132.2 v37,34.5 | v25.8,34.4 25.32,33.91 R126.2 | 25.9,36.2 25.6,35.9 25.2,35.9 24.28,36.82 C130.2 | v22.6,30.7 22.6,30.71 R125.2 | v26,36.3 26.99,36.3 R122.2 | v21.7,36.9 21.21,36.9 R121.2 | v21.7,39.3 21.12,39.3 R120.2 | v39.8,20.3 40.9,21.4 40.9,21.9 39.54,23.26 J10.1 | U12.9 v31.9,37 | U12.15 U12.16 v31.9,43 | v32.6,54.4 32.08,54.4 C121.2 | C120.2 v25.2,54.5 | C117.2 22.3,55.62 | v11.4,59.5 12.03,59.5 C113.2 | v9.8,52.5 9.8,53.42 C112.2 | v2.1,56.8 2.1,56.57 C111.2 | v5.9,56.8 5.9,56.27 C110.2 | R111.2 v6,60.3 | v11.3,53.6 11.94,53.6 U11.5 | R103.2 v46,14 | v50.9,9.2 49.77,9.2 C106.2 | v51.6,3 51.6,4.38 C105.2 | v34,3.7 34.98,3.7 C103.2 | v35.6,12.3 35.33,12.3 C102.2 | C101.2 v35.7,8.1 | v40.8,11.5 40.8,12.48 C100.2 | v37.9,3.7 37.81,3.7 U10.4 | v107.5,4.1 108.46,4.1 U4.3 | v103.4,11.4 102.96,11.4 U3.3 | v81.6,9.9 82.51,9.9 U2.1 | v55,1 U1.40 | v75,0.8 73.94,0.8 U1.1 | v54.4,13.1 53.15,13.1 S2.1 | v83.2,21.8 83.2,22.7 S1.1
  Top 0.3: v88.2,5.3 88.2,4.29 R7.1 | U33.2 97.3,61 | R145.2 123.5,57.68 C210.2 | U20.9A v116,57.2 | R304.2 v41.69,38 | C118.2 21.6,47.22 v21.6,46.23 | C119.2 v24.1,42
  Top 0.35: R6.1 v90.5,5.2 | R4.1 v113.2,3.5 | R3.1 v51.5,17.2 | v110.3,7.5 110.68,7.5 R11.1 | v108.6,5.9 109.41,5.9 Q1.2 | J1.A12 v104.4,9.1 | J1.B12 97.3,7.4 96.6,8.1 96.6,8.8 97.1,9.3 v97.6,9.3 98.05,9.3 J1.A1 | v76.6,14.5 76.6,14.38 C6.1 | v75.3,20.2 75.3,20.78 C5.1 | v88.8,10.4 88.17,10.4 C4.1 | v75,10 75.97,10 C3.1 | v75,3.1 75.97,3.1 C2.1 | v77,8.4 77,7.38 C1.1 | U1.41_8 U1.41_9 U1.41_6 | U1.41_8 U1.41_7 U1.41_4 | U1.41_5 U1.41_8 | U1.41_5 v66.5,9.41 U1.41_6 | U1.41_4 U1.41_5 | U1.41_6 U1.41_3 U1.41_2 | U1.41_2 U1.41_5 | U1.41_4 U1.41_1 U1.41_2
  Top 0.6: 113.3,53.6 v113.3,53.25